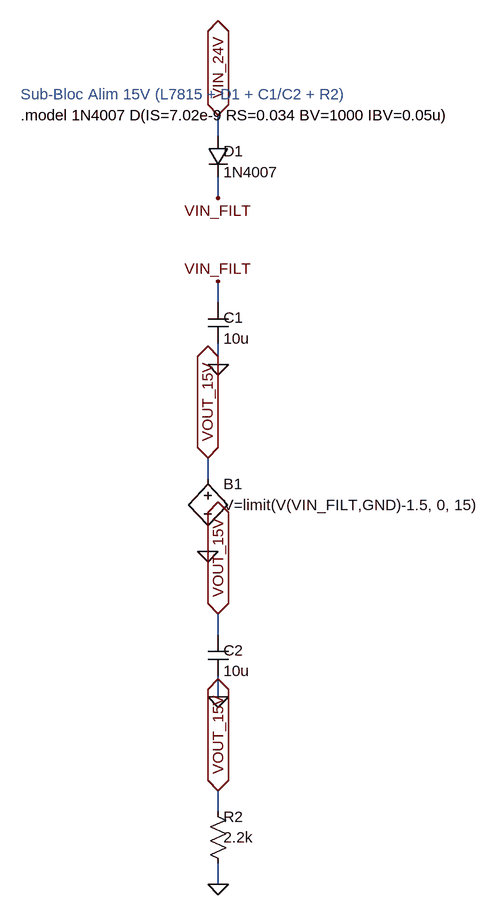
[diagram p0: schematic sub_alim_15v.asc]
sub_alim_15v.asc, the LTspice schematic file:
Version 4
SHEET 1 3200 2400
TEXT 32 32 Left 2 ;Sub-Bloc Alim 15V (L7815 + D1 + C1/C2 + R2)
TEXT 32 64 Left 2 !.model 1N4007 D(IS=7.02e-9 RS=0.034 BV=1000 IBV=0.05u)
SYMBOL diode 320 96 R0
WINDOW 0 24 24 Left 2
WINDOW 3 24 56 Left 2
SYMATTR InstName D1
SYMATTR Value 1N4007
WIRE 336 96 336 64
FLAG 336 64 VIN_24V
IOPIN 336 64 BiDir
WIRE 336 160 336 192
FLAG 336 192 VIN_FILT
SYMBOL cap 320 352 R0
WINDOW 0 24 24 Left 2
WINDOW 3 24 56 Left 2
SYMATTR InstName C1
SYMATTR Value 10u
WIRE 336 352 336 320
FLAG 336 320 VIN_FILT
WIRE 336 416 336 448
FLAG 336 448 0
IOPIN 336 448 BiDir
SYMBOL bv 320 608 R0
WINDOW 0 24 24 Left 2
WINDOW 3 24 56 Left 2
SYMATTR InstName B1
SYMATTR Value V=limit(V(VIN_FILT,GND)-1.5, 0, 15)
WIRE 320 624 320 592
FLAG 320 592 VOUT_15V
IOPIN 320 592 BiDir
WIRE 320 704 320 736
FLAG 320 736 0
IOPIN 320 736 BiDir
SYMBOL cap 320 864 R0
WINDOW 0 24 24 Left 2
WINDOW 3 24 56 Left 2
SYMATTR InstName C2
SYMATTR Value 10u
WIRE 336 864 336 832
FLAG 336 832 VOUT_15V
IOPIN 336 832 BiDir
WIRE 336 928 336 960
FLAG 336 960 0
IOPIN 336 960 BiDir
SYMBOL res 320 1120 R0
WINDOW 0 24 24 Left 2
WINDOW 3 24 56 Left 2
SYMATTR InstName R2
SYMATTR Value 2.2k
WIRE 336 1136 336 1104
FLAG 336 1104 VOUT_15V
IOPIN 336 1104 BiDir
WIRE 336 1216 336 1248
FLAG 336 1248 0
IOPIN 336 1248 BiDir

The netlist it stands for:
* sub_alim_15v.asc
D1 VIN_24V VIN_FILT 1N4007
C1 VIN_FILT 0 10u
B1 VOUT_15V 0 V=limit(V(VIN_FILT,GND)-1.5, 0, 15)
C2 VOUT_15V 0 10u
R2 VOUT_15V 0 2.2k
.model D D
.lib standard.dio
* Sub-Bloc Alim 15V (L7815 + D1 + C1/C2 + R2)
.model 1N4007 D(IS=7.02e-9 RS=0.034 BV=1000 IBV=0.05u)
.backanno
.end